# EasyEDA Pro project Arctos.eprj, schematic Schematic1
Board Name: Board1; Create Date: 2025-07-01; Page Name: P1; Project Name: Arctos; Schematic Name: Schematic1; Update Date: 2025-10-24; Company: arctosrobotics.com; Page Size: A3; Version: V1.3
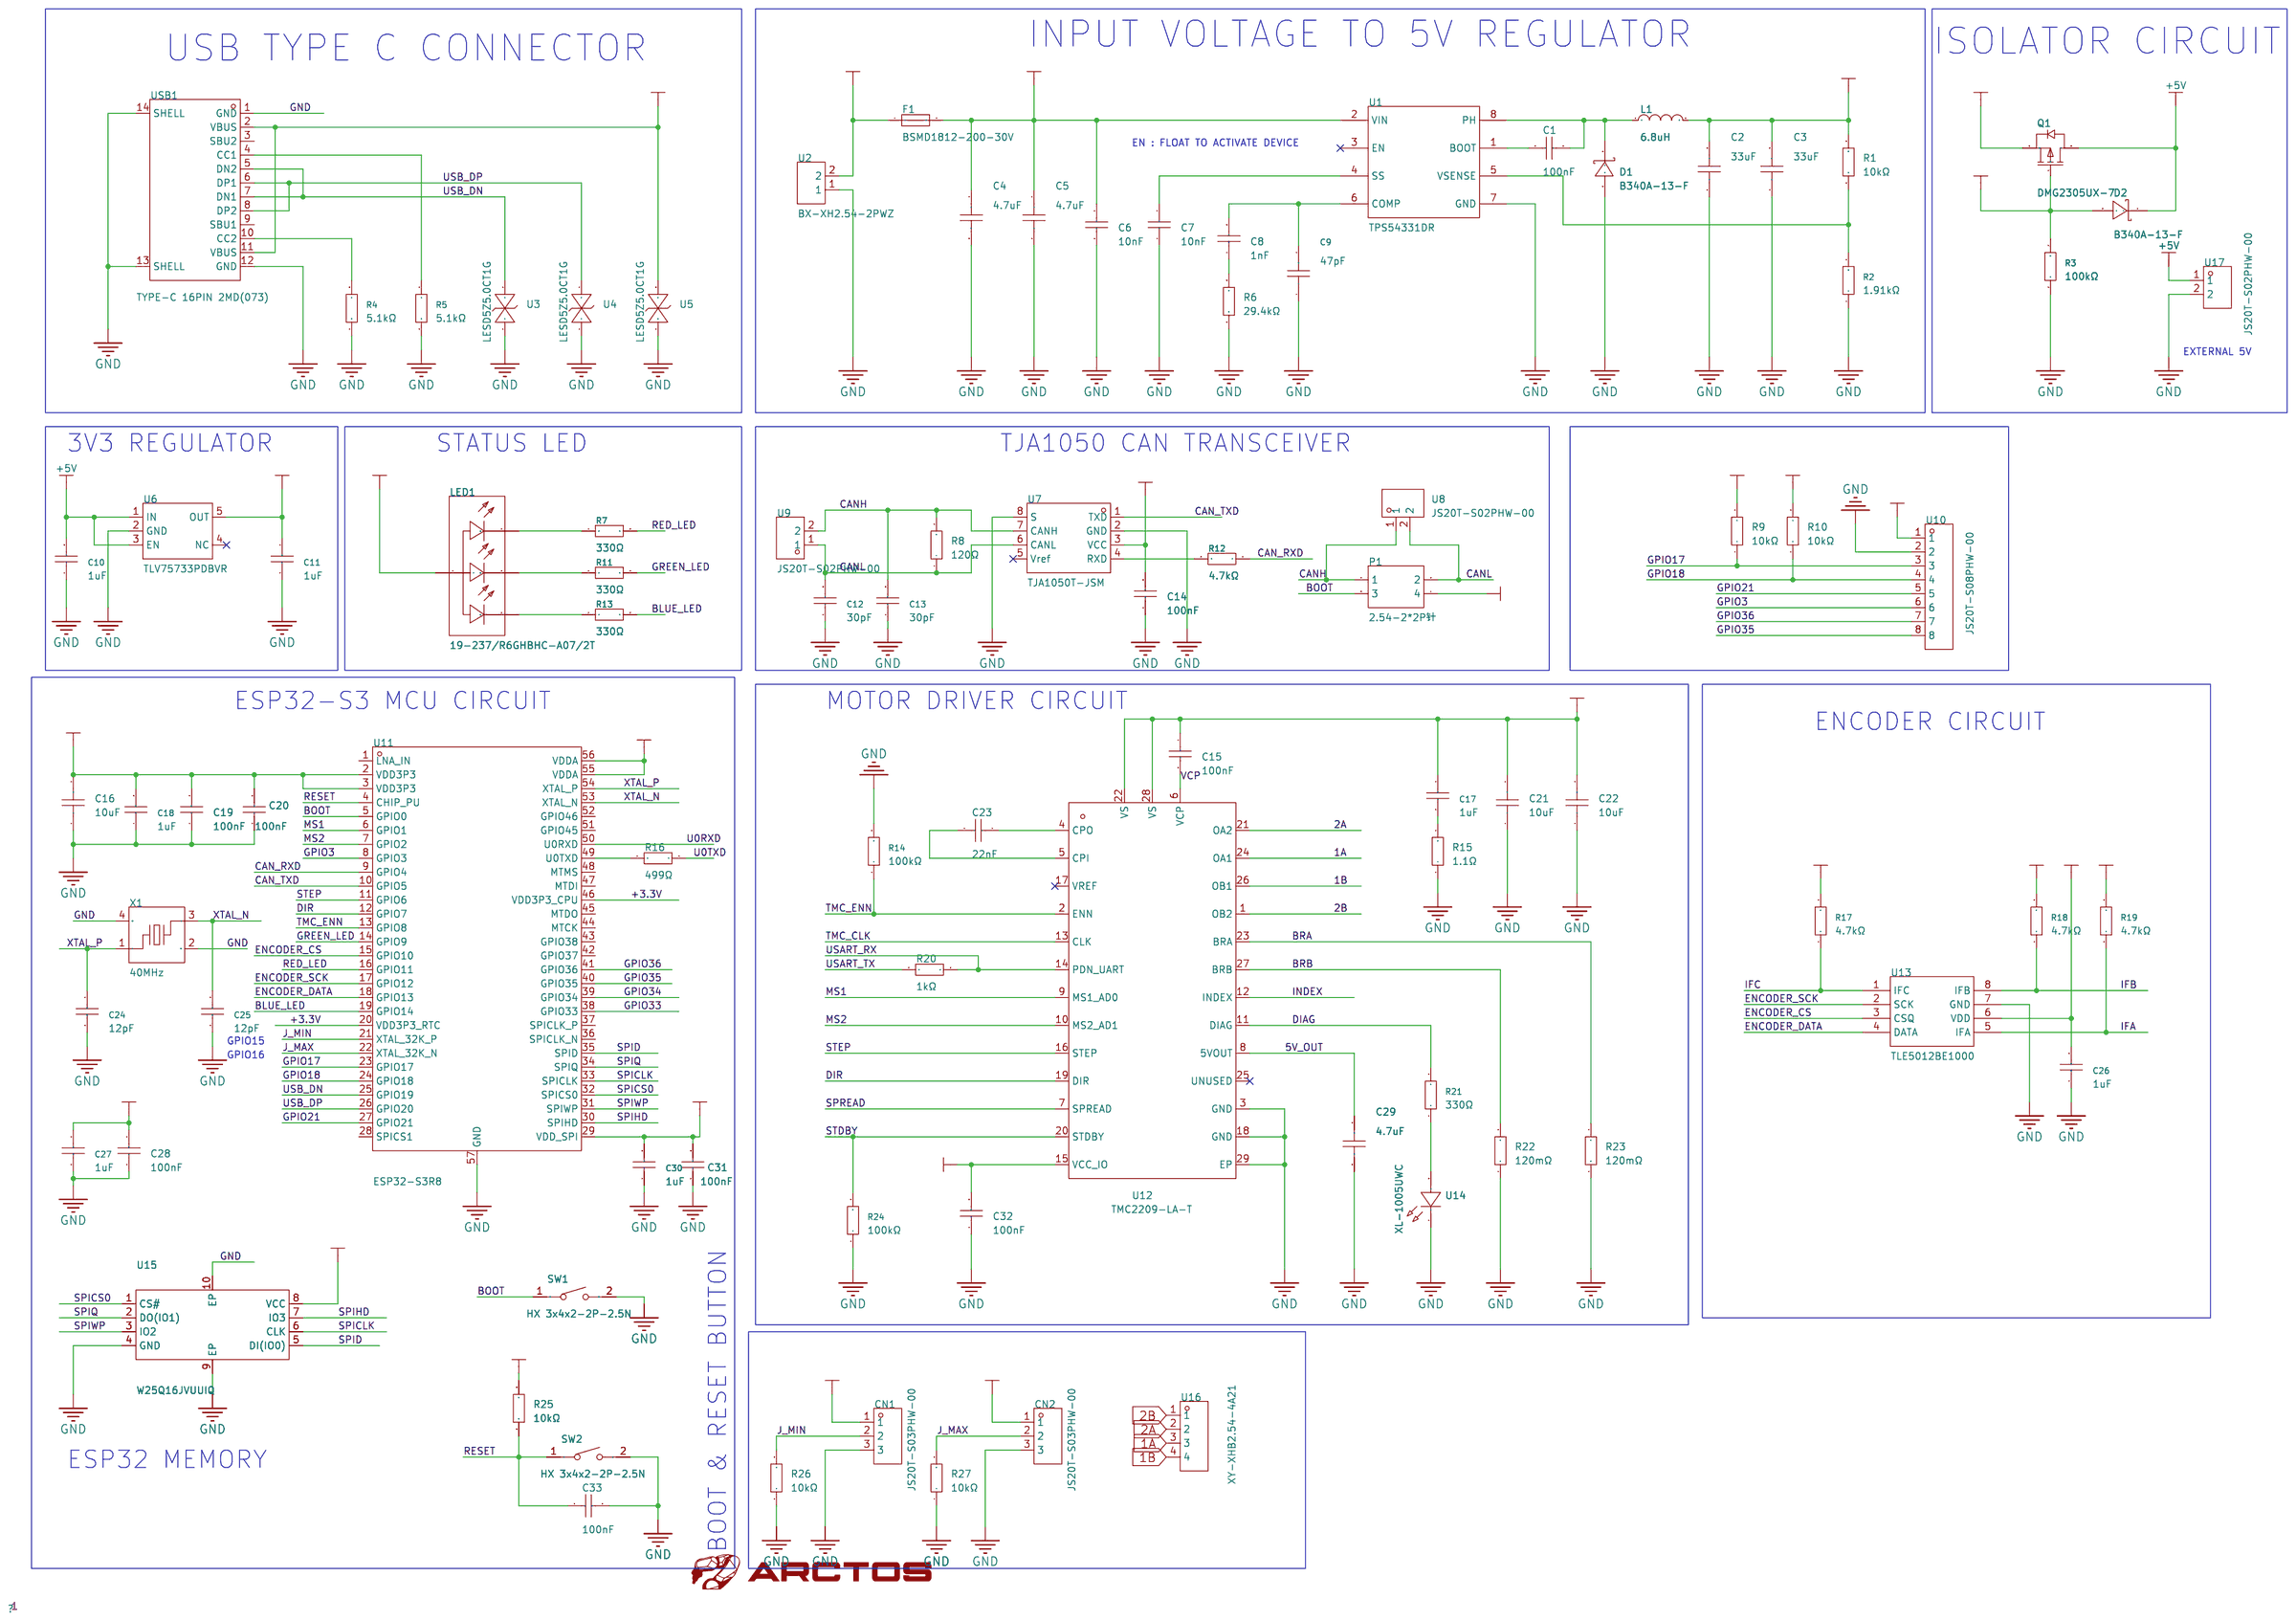
[diagram p0: schematic sheet]

## Parts
C1  100nF  [C0402]
C2  33uF  [C0805]
C3  33uF  [C0805]
C4  4.7uF  [C0603]
C5  4.7uF  [C0603]
C6  10nF  [C0402]
C7  10nF  [C0402]
C8  1nF  [C0402]
C9  47pF  [C0402]
C10  1uF  [C0402]
C11  1uF  [C0402]
C12  30pF  [C0402]
C13  30pF  [C0402]
C14  100nF  [C0402]
C15  100nF  [C0402]
C16  10uF  [C0402]
C17  1uF  [C0805]
C18  1uF  [C0402]
C19  100nF  [C0402]
C20  100nF  [C0402]
C21  10uF  [C0805]
C22  10uF  [C0805]
C23  22nF  [C0402]
C24  12pF  [C0402]
C25  12pF  [C0402]
C26  1uF  [C0402]
C27  1uF  [C0402]
C28  100nF  [C0402]
C29  4.7uF  [C0603]
C30  1uF  [C0402]
C31  100nF  [C0402]
C32  100nF  [C0402]
C33  100nF  [C0402]
CN1  JS20T-S03PHW-00  [CONN-TH_3P-P2.00_HC-PH-3AW-G]
CN2  JS20T-S03PHW-00  [CONN-TH_3P-P2.00_HC-PH-3AW-G]
D1  B340A-13-F  [SMA_L4.4-W2.6-LS5.0-RD]
D2  B340A-13-F  [SMA_L4.4-W2.6-LS5.0-RD]
F1  BSMD1812-200-30V  [F1812]
L1  6.8uH  [IND-SMD_L3.0-W3.0_FTC303020D]
LED1  19-237/R6GHBHC-A07/2T  [LED-ARRAY-SMD_4P-L1.6-W1.6-BL-CW]
P1  2.54-2*2P针  [HDR-TH_4P-P2.54-V-M-R2-C2-S2.54-1]
Q1  DMG2305UX-7  [SOT-23-3_L2.9-W1.3-P1.90-LS2.4-BR]
R1  10kΩ  [R0402]
R2  1.91kΩ  [R0402]
R3  100kΩ  [R0402]
R4  5.1kΩ  [R0402]
R5  5.1kΩ  [R0402]
R6  29.4kΩ  [R0402]
R7  330Ω  [R0402]
R8  120Ω  [R0402]
R9  10kΩ  [R0402]
R10  10kΩ  [R0402]
R11  330Ω  [R0402]
R12  4.7kΩ  [R0402]
R13  330Ω  [R0402]
R14  100kΩ  [R0402]
R15  1.1Ω  [R0603]
R16  499Ω  [R0402]
R17  4.7kΩ  [R0402]
R18  4.7kΩ  [R0402]
R19  4.7kΩ  [R0402]
R20  1kΩ  [R0402]
R21  330Ω  [R0402]
R22  120mΩ  [R1206]
R23  120mΩ  [R1206]
R24  100kΩ  [R0402]
R25  10kΩ  [R0402]
R26  10kΩ  [R0402]
R27  10kΩ  [R0402]
SW1  HX 3x4x2-2P-2.5N  [SW-SMD_L4.0-W2.9-LS5.0]
SW2  HX 3x4x2-2P-2.5N  [SW-SMD_L4.0-W2.9-LS5.0]
U1  TPS54331DR  [SOIC-8_L5.0-W4.0-P1.27-LS6.0-BL]
U2  BX-XH2.54-2PWZ  [CONN-TH_2P-P2.50_BX-XH2.54-2PWZ]
U3  LESD5Z5.0CT1G  [SOD-523_L1.2-W0.8-LS1.6-BI]
U4  LESD5Z5.0CT1G  [SOD-523_L1.2-W0.8-LS1.6-BI]
U5  LESD5Z5.0CT1G  [SOD-523_L1.2-W0.8-LS1.6-BI]
U6  TLV75733PDBVR  [SOT-23-5_L2.9-W1.6-P0.95-LS2.8-BL]
U7  TJA1050T-JSM  [SOIC-8_L4.9-W3.9-P1.27-LS6.0-BL]
U8  JS20T-S02PHW-00  [CONN-TH_JS20T-S02PHW-00]
U9  JS20T-S02PHW-00  [CONN-TH_JS20T-S02PHW-00]
U10  JS20T-S08PHW-00  [CONN-TH_8P-P2.00_JS20T-S08PHW]
U11  ESP32-S3R8  [QFN-56_L7.0-W7.0-P0.40-TL-EP4.0]
U12  TMC2209-LA-T  [QFN-28_L5.0-W5.0-P0.50-BL-EP]
U13  TLE5012BE1000  [PG-DSO-8_L5.0-W4.0-P1.27-LS6.0-BL]
U14  XL-1005UWC  [LED0402-RD_YELLOW]
U15  W25Q16JVUUIQ  [USON-8_L4.0-W3.0-P0.80-BL_AT25SL321]
U16  XY-XHB2.54-4A21  [HDR-TH_4P-P2.50-H-F-W7.3-N]
U17  JS20T-S02PHW-00  [CONN-TH_JS20T-S02PHW-00]
USB1  TYPE-C 16PIN 2MD(073)  [USB-C-SMD_TYPE-C-6PIN-2MD-073]
X1  40MHz  [CRYSTAL-SMD_4P-L1.6-W1.2-BL]

## Library data of the parts
C1 C14 C15 C19 C20 C28 C31-C33 = CC0402KRX7R9BB104: LCSC Part Name: 100nF ±10% 50V; Supplier Part: C131394; Manufacturer: YAGEO(国巨); Supplier Footprint: 0402; Datasheet: https://atta.szlcsc.com/upload/public/pdf/source/20181008/C309510_22F155564471FAF6A489F7D68F34234E.pdf; Supplier: LCSC; Tolerance: ±10%
C2 C3 = C2012X5R1A336MTJ00E: LCSC Part Name: 33uF ±20% 10V; Supplier Part: C342635; Manufacturer: TDK; Supplier Footprint: 0805; Datasheet: https://item.szlcsc.com/datasheet/C2012X5R1A336MTJ00E/319485.html; Supplier: LCSC; Tolerance: ±20%; Voltage Rating: 10V; Temperature Coefficient: X5R
C4 C5 C29 = CL10A475KL8NRNC: LCSC Part Name: 4.7uF ±10% 35V; Supplier Part: C307467; Manufacturer: SAMSUNG(三星); Supplier Footprint: 0603; JLCPCB Part Class: Extended Part; Datasheet: https://item.szlcsc.com/datasheet/CL10A475KL8NRNC/291141.html; Supplier: LCSC; Tolerance: ±10%; Voltage Rating: 35V; Temperature Coefficient: X5R
C6 C7 = CL05B103KB5NNNC: LCSC Part Name: 10nF ±10% 50V; Supplier Part: C15195; Manufacturer: SAMSUNG(三星); Supplier Footprint: 0402; JLCPCB Part Class: Basic Part; Datasheet: https://item.szlcsc.com/datasheet/CL05B103KB5NNNC/15869.html; Supplier: LCSC; Tolerance: ±10%; Voltage Rating: 50V; Temperature Coefficient: X7R
C8 = CL05B102KB5NNNC: LCSC Part Name: 1nF ±10% 50V; Supplier Part: C14442; Manufacturer: SAMSUNG(三星); Supplier Footprint: 0402; Datasheet: https://item.szlcsc.com/datasheet/CL05B102KB5NNNC/15104.html; Supplier: LCSC; Tolerance: ±10%; Voltage Rating: 50V; Temperature Coefficient: X7R
C9 = CL05C470JB51PNC: LCSC Part Name: 47pF ±5% 50V; Supplier Part: C472454; Manufacturer: SAMSUNG(三星); Supplier Footprint: 0402; Datasheet: https://item.szlcsc.com/datasheet/CL05C470JB51PNC/478910.html; Supplier: LCSC; Tolerance: ±5%; Voltage Rating: 50V; Temperature Coefficient: C0G
C10 C11 C18 C26 C27 C30 = CL05A105KO5NNNC: LCSC Part Name: 1uF ±10% 16V; Supplier Part: C29266; Manufacturer: SAMSUNG(三星); Supplier Footprint: 0402; JLCPCB Part Class: Extended Part; Datasheet: https://item.szlcsc.com/datasheet/CL05A105KO5NNNC/30018.html; Supplier: LCSC; Tolerance: ±10%; Voltage Rating: 16V; Temperature Coefficient: X5R
C12 C13 = CC0402JRNPO9BN300: LCSC Part Name: 30pF ±5% 50V; Supplier Part: C107004; Manufacturer: YAGEO(国巨); Supplier Footprint: 0402; Datasheet: https://item.szlcsc.com/datasheet/CC0402JRNPO9BN300/108220.html; Supplier: LCSC; Tolerance: ±5%; Voltage Rating: 50V; Temperature Coefficient: NP0
C16 = CL05A106MP5NUNC_C315248: LCSC Part Name: 10uF ±20% 10V; Supplier Part: C315248; Manufacturer: SAMSUNG(三星); Manufacturer Part: CL05A106MP5NUNC; Supplier Footprint: 0402; Datasheet: https://item.szlcsc.com/datasheet/CL05A106MP5NUNC/297154.html; Supplier: LCSC; Tolerance: ±20%; Voltage Rating: 10V; Temperature Coefficient: X5R
C17 = CL21B105KBFNNNE: LCSC Part Name: 1uF ±10% 50V; Supplier Part: C28323; Manufacturer: SAMSUNG(三星); Supplier Footprint: 0805; JLCPCB Part Class: Basic Part; Datasheet: https://item.szlcsc.com/datasheet/CL21B105KBFNNNE/29074.html; Supplier: LCSC; Tolerance: ±10%; Voltage Rating: 50V; Temperature Coefficient: X7R
C21 C22 = CL21A106KBYQNNE: LCSC Part Name: 10uF ±10% 50V; Supplier Part: C2932476; Manufacturer: SAMSUNG(三星); Supplier Footprint: 0805; Datasheet: https://item.szlcsc.com/datasheet/CL21A106KBYQNNE/3277789.html; Supplier: LCSC; Tolerance: ±10%; Voltage Rating: 50V; Temperature Coefficient: X5R
C23 = CL05B223KB5NNNC: LCSC Part Name: 22nF ±10% 50V; Supplier Part: C337699; Manufacturer: SAMSUNG(三星); Supplier Footprint: 0402; Datasheet: https://item.szlcsc.com/datasheet/CL05B223KB5NNNC/315756.html; Supplier: LCSC; Tolerance: ±10%; Voltage Rating: 50V; Temperature Coefficient: X7R
C24 C25 = CL05C120JB5NNNC: LCSC Part Name: 12pF ±5% 50V; Supplier Part: C26406; Manufacturer: SAMSUNG(三星); Supplier Footprint: 0402; Datasheet: https://item.szlcsc.com/datasheet/CL05C120JB5NNNC/27150.html; Supplier: LCSC; Tolerance: ±5%; Voltage Rating: 50V; Temperature Coefficient: C0G
CN1 CN2 = JS20T-S03PHW-00: Supplier Part: C7499303; Manufacturer: JS(钜硕电子); Supplier Footprint: 插件,P=2.0mm; JLCPCB Part Class: Extended Part; Datasheet: https://atta.szlcsc.com/upload/public/pdf/source/20230809/E6337CD797A912ED7011A9EA7A78FFDE.pdf; Supplier: LCSC; Pins Structure: 1x3P; Pitch: 2mm; Mounting Style: Bend insert; Reference Series: PH; Number of Pins: 3P; Number of Rows: 1; Number of PINs Per Row: 3; Contact Material: Brass
D1 D2 = B340A-13-F: LCSC Part Name: 电压:40V 电流:3A; Supplier Part: C85098; Manufacturer: DIODES(美台); Supplier Footprint: SMA(DO-214AC); Datasheet: https://item.szlcsc.com/datasheet/B340A-13-F/86270.html; Supplier: LCSC; Voltage - Forward(Vf@If): 500mV@3A; Voltage - DC Reverse(Vr): 40V; Current - Rectified: 3A; Reverse Leakage Current (Ir): 500uA@40V; Operating Junction Temperature Range: -55℃~+150℃; Non-Repetitive Peak Forward Surge Current: 80A
F1 = BSMD1812-200-30V: LCSC Part Name: 30V 2A 1812自恢复; Supplier Part: C960026; Manufacturer: BHFUSE(佰宏); Supplier Footprint: 1812; JLCPCB Part Class: Extended Part; Datasheet: https://item.szlcsc.com/datasheet/BSMD1812-200-30V/1039126.html; Supplier: LCSC; Voltage - Max: 30V; Current - Max: 40A; Hold Current: 2A; Trip Current: 4A; Power Dissipation: 1W; Resistance - Initial (Ri) (Min): 20mΩ; Resistance - Post Trip (R1) (Max): 100mΩ; Operating Temperature: -40℃~+85℃; Length: 4.73mm; Width: 3.41mm; Height: 1.5mm
L1 = FTC303020D6R8MBCA: LCSC Part Name: 6.8uH ±20% 4.5A; Supplier Part: C7423322; Manufacturer: cjiang(长江微电); Supplier Footprint: SMD,3x3mm; Datasheet: https://atta.szlcsc.com/upload/public/pdf/source/20240918/5AD8A1A0D9C2859F32750FF2CC514AFA.pdf; Supplier: LCSC; Tolerance: ±20%; Current Rating: 3.2A; Current - Saturation(Isat): 4.5A; DC Resistance(DCR): 107mΩ
LED1 = 19-237/R6GHBHC-A07/2T: LCSC Part Name: RGB三色; Supplier Part: C264511; Manufacturer: EVERLIGHT(亿光); Supplier Footprint: 0606; JLCPCB Part Class: Extended Part; Datasheet: https://atta.szlcsc.com/upload/public/pdf/source/20180817/C264511_F0AB6A4CBE46616C77A38D5D38B86709.pdf; Supplier: LCSC
P1 = 2.54-2*2P针: LCSC Part Name: 间距:2.54mm 直插; Supplier Part: C66690; Manufacturer: BOOMELE(博穆精密); Supplier Footprint: 插件,P=2.54mm; JLCPCB Part Class: Extended Part; Datasheet: https://atta.szlcsc.com/upload/public/pdf/source/20221201/C605E3BE9C0F7226363017EFD1BDE852.pdf; Supplier: LCSC; Pitch: 2.54mm; Row Spacing: 2.54mm; Mounting Type: Straight; Number of Rows: Double Row; Number of Pins: 4P; Color: Black
Q1 = DMG2305UX-7: LCSC Part Name: 1个P沟道 耐压:20V 电流:5A; Supplier Part: C150470; Manufacturer: DIODES(美台); Supplier Footprint: SOT-23; Datasheet: https://item.szlcsc.com/datasheet/DMG2305UX-7/161808.html; Supplier: LCSC; Number: 1 P-Channel; Drain to Source Voltage: 20V; Current - Continuous Drain(Id): 5A; RDS(on): 52mΩ@4.5V；100mΩ@2.5V; Pd - Power Dissipation: 1.4W; Gate Threshold Voltage (Vgs(th)): 900mV@250uA; Gate Charge(Qg): 10.2nC@4.5V; Input Capacitance(Ciss): 808pF; Reverse Transfer Capacitance (Crss@Vds): 77pF; Operating Temperature: -55℃~+150℃; Type: P-Channel; Output Capacitance(Coss): 85pF
R1 R9 R10 R25-R27 = 0402WGF1002TCE: LCSC Part Name: 10kΩ ±1% 62.5mW 厚膜电阻; Supplier Part: C25744; Manufacturer: UNI-ROYAL(厚声); Supplier Footprint: 0402; Datasheet: https://item.szlcsc.com/datasheet/0402WGF1002TCE/26487.html; Supplier: LCSC; Type: Thick Film Resistor; Tolerance: ±1%; Power(Watts): 62.5mW; Voltage-Supply(Max): 50V; Temperature Coefficient: ±100ppm/℃; Operating Temperature: -55℃~+155℃
R2 = 0402WGF1911TCE: LCSC Part Name: 1.91kΩ ±1% 62.5mW 厚膜电阻; Supplier Part: C36951; Manufacturer: UNI-ROYAL(厚声); Supplier Footprint: 0402; Datasheet: https://item.szlcsc.com/datasheet/0402WGF1911TCE/37929.html; Supplier: LCSC; Type: Thick Film Resistor; Tolerance: ±1%; Power(Watts): 62.5mW; Voltage-Supply(Max): 50V; Temperature Coefficient: ±100ppm/℃; Operating Temperature: -55℃~+155℃
R3 R14 R24 = 0402WGF1003TCE: LCSC Part Name: 100kΩ ±1% 62.5mW 厚膜电阻; Supplier Part: C25741; Manufacturer: UNI-ROYAL(厚声); Supplier Footprint: 0402; Datasheet: https://item.szlcsc.com/datasheet/0402WGF1003TCE/26484.html; Supplier: LCSC; Type: Thick Film Resistor; Tolerance: ±1%; Power(Watts): 62.5mW; Voltage-Supply(Max): 50V; Temperature Coefficient: ±100ppm/℃; Operating Temperature: -55℃~+155℃
R4 R5 = 0402WGF5101TCE: LCSC Part Name: 5.1kΩ ±1% 62.5mW 厚膜电阻; Supplier Part: C25905; Manufacturer: UNI-ROYAL(厚声); Supplier Footprint: 0402; Datasheet: https://item.szlcsc.com/datasheet/0402WGF5101TCE/26648.html; Supplier: LCSC; Type: Thick Film Resistor; Tolerance: ±1%; Power(Watts): 62.5mW; Voltage-Supply(Max): 50V; Temperature Coefficient: ±100ppm/℃; Operating Temperature: -55℃~+155℃
R6 = RC0402FR-0729K4L: LCSC Part Name: 厚膜电阻 29.4kΩ ±1% 62.5mW; Supplier Part: C327356; Manufacturer: YAGEO(国巨); Supplier Footprint: 0402; JLCPCB Part Class: Extended Part; Datasheet: https://item.szlcsc.com/datasheet/RC0402FR-0729K4L/307450.html; Supplier: LCSC; Type: Thick Film Resistor; Tolerance: ±1%; Power(Watts): 62.5mW; Voltage-Supply(Max): 50V; Temperature Coefficient: ±100ppm/℃; Operating Temperature: -55℃~+155℃
R7 R11 R13 R21 = 0402WGF3300TCE: LCSC Part Name: 330Ω ±1% 62.5mW 厚膜电阻; Supplier Part: C25104; Manufacturer: UNI-ROYAL(厚声); Supplier Footprint: 0402; Datasheet: https://item.szlcsc.com/datasheet/0402WGF3300TCE/25847.html; Supplier: LCSC; Type: Thick Film Resistors; Tolerance: ±1%; Power(Watts): 1/16W; Voltage-Supply(Max): 50V; Temperature Coefficient: ±100ppm/℃; Operating Temperature: -55℃~+155℃
R8 = 0402WGF1200TCE: LCSC Part Name: 120Ω ±1% 62.5mW 厚膜电阻; Supplier Part: C25079; Manufacturer: UNI-ROYAL(厚声); Supplier Footprint: 0402; Datasheet: https://item.szlcsc.com/datasheet/0402WGF1200TCE/25822.html; Supplier: LCSC; Type: Thick Film Resistor; Tolerance: ±1%; Power(Watts): 62.5mW; Voltage-Supply(Max): 50V; Temperature Coefficient: ±100ppm/℃; Operating Temperature: -55℃~+155℃
R12 R17-R19 = 0402WGF4701TCE: LCSC Part Name: 4.7kΩ ±1% 62.5mW 厚膜电阻; Supplier Part: C25900; Manufacturer: UNI-ROYAL(厚声); Supplier Footprint: 0402; Datasheet: https://item.szlcsc.com/datasheet/0402WGF4701TCE/26643.html; Supplier: LCSC; Type: Thick Film Resistor; Tolerance: ±1%; Power(Watts): 62.5mW; Voltage-Supply(Max): 50V; Temperature Coefficient: ±100ppm/℃; Operating Temperature: -55℃~+155℃
R15 = RC0603FR-071R1L: LCSC Part Name: 厚膜电阻 1.1Ω ±1% 100mW; Supplier Part: C309559; Manufacturer: YAGEO(国巨); Supplier Footprint: 0603; Datasheet: https://atta.szlcsc.com/upload/public/pdf/source/20250610/89E4D743C004A82A45145C7A2CC3A578.pdf; Supplier: LCSC; Type: Thick Film Resistor; Tolerance: ±1%; Power(Watts): 100mW; Voltage-Supply(Max): 75V; Temperature Coefficient: ±200ppm/℃; Operating Temperature: -55℃~+155℃
R16 = 0402WGF4990TCE: LCSC Part Name: 499Ω ±1% 62.5mW 厚膜电阻; Supplier Part: C4125; Manufacturer: UNI-ROYAL(厚声); Supplier Footprint: 0402; Datasheet: https://atta.szlcsc.com/upload/public/pdf/source/20200306/C422600_1E6D84923E4A46A82E41ADD87F860B5C.pdf; Supplier: LCSC; Type: Thick Film Resistors; Tolerance: ±1%; Temperature Coefficient: ±100ppm/℃; Operating Temperature Range: -55℃~+155℃
R20 = 0402WGF1001TCE: LCSC Part Name: 1kΩ ±1% 62.5mW 厚膜电阻; Supplier Part: C11702; Manufacturer: UNI-ROYAL(厚声); Supplier Footprint: 0402; Datasheet: https://item.szlcsc.com/datasheet/0402WGF1001TCE/12256.html; Supplier: LCSC; Type: Thick Film Resistor; Tolerance: ±1%; Power(Watts): 62.5mW; Voltage-Supply(Max): 50V; Temperature Coefficient: ±100ppm/℃; Operating Temperature: -55℃~+155℃
R22 R23 = STE1206M1W0R120F: LCSC Part Name: 120mΩ ±1% 1W; Supplier Part: C201309; Manufacturer: WALTER(华德); Supplier Footprint: 1206; Datasheet: https://item.szlcsc.com/datasheet/STE1206M1W0R120F/202615.html; Supplier: LCSC; Tolerance: ±1%; Power(Watts): 1W; Temperature Coefficient: ±50ppm/℃
SW1 SW2 = HX 3x4x2-2P-2.5N: LCSC Part Name: 4*3*2mm 立贴 轻触开关; Supplier Part: C36498961; Manufacturer: hanxia(韩下); Supplier Footprint: SMD,3x4mm; JLCPCB Part Class: Extended Part; Datasheet: https://atta.szlcsc.com/upload/public/pdf/source/20241226/E966882069CEFB4DD959391A5A1F9528.pdf; Supplier: LCSC; Actuator Style: Star-Shaped Button; Operating Force: 2.5N; Mounting Style: Standing paste; Switch Length: 4mm; Switch Width: 3mm; Switch Height: 2mm; Contact Current: 50mA; Voltage Rating: 12V; Actuator/Cap Color: Black; With Lamp: None; Pin Style: SMDSplicing; Mechanical Life: 100,000 Times; Operating Temperature: -25℃~+70℃
U1 = TPS54331DR: LCSC Part Name: 3A, 28V 输入非同步降压转换器; Supplier Part: C9865; Manufacturer: TI(德州仪器); Supplier Footprint: SOIC-8; JLCPCB Part Class: Extended Part; Datasheet: https://www.ti.com/cn/lit/gpn/tps54331; Supplier: LCSC; Function: Step-down type; Output Type: Adjustable; Input Voltage: 3.5V~28V; Output Current: 3A; Switching Frequency: 570kHz; Operating Temperature: -40℃~+150℃@(TJ); Synchronous Rectification: No; Number of Outputs: 1; Topology: Step-down; Quiescent Current (Iq): 1mA; Switch tube (built-in/external): Built-in
U2 = BX-XH2.54-2PWZ: LCSC Part Name: 1x2P 间距:2.5mm 弯插 系列:XH; Supplier Part: C18077842; Manufacturer: Bossie(博锡); Supplier Footprint: 弯插,P=2.54mm; JLCPCB Part Class: Extended Part; Datasheet: https://atta.szlcsc.com/upload/public/pdf/source/20231017/64887DF7727E4B3D8F2333E1BBE193AA.pdf; Supplier: LCSC; Pins Structure: 1x2P; Pitch: 2.5mm; Mounting Type: Bend-in; Reference Series: XH; Number of Pins: 2P; Number of Rows: 1; Number of PINs Per Row: 2; Current Rating: 3A; Contact Material: Brass; Contact Plating: Tin; Operating Temperature: -25℃~+85℃; Voltage Rating: 250V; Plastic Material: PA66; Flame Retardant Rating: UL94V-0; Color: White; Z-Height of the Board: 5.9mm; X-Length of Bottom Edge on Board (Spacing Line): 7.5mm; Y-Width of Bottom Edge on Board: 7.32mm
U3-U5 = LESD5Z5.0CT1G_C5451650: LCSC Part Name: 5V 15PF 双向; Supplier Part: C5451650; Manufacturer: HXY MOSFET(华轩阳电子); Supplier Footprint: SOD-523; JLCPCB Part Class: Extended Part; Datasheet: https://atta.szlcsc.com/upload/public/pdf/source/20230427/2F645B9D698C2F305680EBFB223778D0.pdf; Supplier: LCSC; polarity: Bidirectional; Reverse Stand-Off Voltage (Vrwm): 5V; Maximum Clamping Voltage: 11.6V; Peak Pulse Current (Ipp): 9A; Breakdown Voltage: 7.8V; Number of Lines: Single channel; Type: ESD
U6 = TLV75733PDBVR: LCSC Part Name: 具有使能功能的 1A、低 IQ、高精度、低压降稳压器; Supplier Part: C485517; Manufacturer: TI(德州仪器); Supplier Footprint: SOT-23-5; JLCPCB Part Class: Extended Part; Datasheet: https://www.ti.com/cn/lit/gpn/tlv757p; Supplier: LCSC; Output Type: Fixed; Maximum Input Voltage: 5.5V; Output Voltage: 3.3V; Output Current: 1A; Power Supply Rejection Ratio (PSRR): 52dB; Dropout Voltage: 475mV@(1A); Feature: ESD Protection；Surge Protection；Low ESR；Thermal Protection(TSD)；Under-voltage Lockout；Overcurrent Protection(OCP)；With ability; Operating Temperature: -40℃~+125℃@(Tj); Output Polarity: Positive electrode; Number of Outputs: 1
U7 = TJA1050T-JSM: LCSC Part Name: TJA1050T; Supplier Part: C21714366; Manufacturer: JSMSEMI(杰盛微); Supplier Footprint: SOP-8; Datasheet: https://item.szlcsc.com/datasheet/TJA1050T-JSM/23141576.html; Supplier: LCSC; Data Rate: 1Mbps; Voltage - Supply: 4.5V~5.5V; Current - Supply: 50mA; Operating Temperature: -40℃~+150℃
U8 U9 U17 = JS20T-S02PHW-00: Supplier Part: C7499302; Manufacturer: JS(钜硕电子); Supplier Footprint: 插件,P=2.0mm; JLCPCB Part Class: Extended Part; Datasheet: https://atta.szlcsc.com/upload/public/pdf/source/20230809/E6337CD797A912ED7011A9EA7A78FFDE.pdf; Supplier: LCSC; Pins Structure: 1x2P; Pitch: 2mm; Mounting Style: Bend insert; Reference Series: PH; Number of Pins: 2P; Number of Rows: 1; Number of PINs Per Row: 2; Contact Material: Brass
U10 = JS20T-S08PHW-00: Supplier Part: C7499308; Manufacturer: JS(钜硕电子); Supplier Footprint: 插件,P=2.0mm; JLCPCB Part Class: Extended Part; Datasheet: https://atta.szlcsc.com/upload/public/pdf/source/20230809/E6337CD797A912ED7011A9EA7A78FFDE.pdf; Supplier: LCSC; Pins Structure: 1x8P; Pitch: 2mm; Mounting Style: Bend-in; Reference Series: PH; Number of Pins: 8P; Number of Rows: 1; Number of PINs Per Row: 8; Contact Material: Brass
U11 = ESP32-S3R8: Supplier Part: C2913194; Manufacturer: ESPRESSIF(乐鑫); Supplier Footprint: QFN-56(7x7); JLCPCB Part Class: Extended Part; Datasheet: https://item.szlcsc.com/datasheet/ESP32-S3R8/3198292.html; Supplier: LCSC; Frequency Range: 2.412GHz~2.484GHz; Interface: I2C；I2S；UART；USB；SPI; Voltage - Supply: 3V~3.6V; Applications: Bluetooth；IoT；WiFi; Output Power: 18.5dBm; Data Rate: 150Mbps; Current Of Transmitting: 283mA; Sensitivity: -74.2dBm; Receive Current: 88mA; Typical Application Frequency: 2.4GHz; Operating Temperature: -40℃~+65℃
U12 = TMC2209-LA-T: Technology:Yes Voltage - Supply:4.75V~29V Voltage - Supply:4.75V~29V Output Current:- Output Current:- Interface:STEP/DIR；UART Step Resolution:8；64；256；16；32 RDS(on):340mΩ Operating Temperature:-40℃~+125℃ Operating Temperature:-40℃~+125℃; LCSC Part Name: 2A 5.25V电机驱动芯片; Supplier Part: C2150710; Manufacturer: TRINAMIC; Supplier Footprint: QFN-28-EP(5x5); JLCPCB Part Class: Extended Part; Datasheet: https://atta.szlcsc.com/upload/public/pdf/source/20210607/D0A4AAF613355E2D9215E68319997CCC.pdf; Supplier: LCSC; Technology: Yes; Voltage - Supply: 4.75V~29V; Interface: STEP/DIR；UART; Step Resolution: 8；64；256；16；32; RDS(on): 340mΩ; Operating Temperature: -40℃~+125℃
U13 = TLE5012BE1000: Supplier Part: C123083; Manufacturer: Infineon(英飞凌); Supplier Footprint: SO-8; JLCPCB Part Class: Extended Part; Datasheet: https://atta.szlcsc.com/upload/public/pdf/source/20170728/C123083_1501225763065848823.pdf; Supplier: LCSC
U14 = XL-1005UWC_C20613596: Supplier Part: C20613596; Manufacturer: XINGLIGHT(成兴光); Supplier Footprint: 0402; Datasheet: https://atta.szlcsc.com/upload/public/pdf/source/20221102/EACC1BAE175C81995A6088DD8BE6A010.pdf; Supplier: LCSC
U15 = W25Q16JVUUIQ: LCSC Part Name: 支持双/四路SPI接口的3V、16Mbit 串行闪存; Supplier Part: C571259; Manufacturer: Winbond(华邦); Supplier Footprint: USON-8(3x4); Datasheet: https://item.szlcsc.com/datasheet/W25Q16JVUUIQ/597703.html; Supplier: LCSC; Interface: SPI; Memory Size: 16Mbit; Clock Frequency: 133MHz; Voltage - Supply: 2.7V~3.6V; Program / Erase Cycles: 100,000 Cycles; Page Programming Time (Tpp): 400us; Block Erase Time(tBE): 150ms@(64KB); Data Retention - TDR (Year): 20 Years; Operating Temperature: -40℃~+85℃
U16 = XY-XHB2.54-4A21: LCSC Part Name: 1x4P 间距:2.54mm 弯插; Supplier Part: C19271397; Manufacturer: XYECONN(辛译); Supplier Footprint: 弯插,P=2.54mm; JLCPCB Part Class: Extended Part; Datasheet: https://atta.szlcsc.com/upload/public/pdf/source/20231124/E581531705911B495C6E735B7C4EA3F8.pdf; Supplier: LCSC; Pins Structure: 1x4P; Pitch: 2.54mm; Mounting Style: Right-Angle; Number of Pins: 4P; Number of Rows: 1; Number of PINs Per Row: 4; Row Spacing: 2.54mm; Current Rating (Max): 2A; Operating Temperature Range: -25℃~+85℃
USB1 = TYPE-C 16PIN 2MD(073): LCSC Part Name: Type-C 母 卧贴; Supplier Part: C2765186; Manufacturer: SHOU HAN(首韩); Supplier Footprint: SMD; JLCPCB Part Class: Extended Part; Datasheet: https://atta.szlcsc.com/upload/public/pdf/source/20250506/FFB74EDFDFA0AC372CE4A8E4F739CCEF.pdf; Supplier: LCSC; Connector Type: Type-C; Protocol Standard: USB 3.1; Gender: Female; Mounting Type: Surface Mount, Right Angle; Number of Contacts: 16P; Number of Ports: 1; Current Rating-Power: 3A; Voltage Rating: 5V; Connect-Disconnect Life: 5,000 Cycles; Detection color: Black; Operating Temperature: -25℃~+85℃
X1 = SX0B40.000F0810F30: LCSC Part Name: 40MHz ±10ppm 8pF; Supplier Part: C7301926; Manufacturer: SCTF(星通时频); Supplier Footprint: SMD1612-4P; Datasheet: https://item.szlcsc.com/datasheet/SX0B40.000F0810F30/8272179.html; Supplier: LCSC; Type: Crystal Oscillator; Normal temperature Frequency Tolerance: ±10ppm; Load Capacitance: 8pF; Frequency Stability: ±30ppm; Equivalent Series Resistance(ESR): 80Ω; Operating Temperature: -40℃~+85℃

## Nets
5V_OUT: C29.1 U12.8(5VOUT)
+3.3V: C11.2 C14.2 C16.2 C18.2 C19.2 C20.2 C26.2 C27.2 C28.2 C32.2 CN1.1 CN2.1 LED1.4(+) P1.4 R9.2 R10.2 R17.2 R18.2 R19.2 R25.2 U6.5(OUT) U7.3(VCC) U10.1 U11.2(VDD3P3) U11.3(VDD3P3) U11.20(VDD3P3_RTC) U11.46(VDD3P3_CPU) U11.55(VDDA) U11.56(VDDA) U12.15(VCC_IO) U13.6(VDD)
+5V: C10.2 D2.1(K) Q1.3(D) U6.1(IN) U6.3(EN) U17.1
+24V: C15.1 C17.2 C21.2 C22.2 F1.1 U2.2 U12.22(VS) U12.28(VS)
GND: C2.1 C3.1 C4.2 C5.2 C6.1 C7.1 C9.1 C10.1 C11.1 C12.1 C13.1 C14.1 C16.1 C18.1 C19.1 C20.1 C21.1 C22.1 C24.1 C25.1 C26.1 C27.1 C28.1 C29.2 C30.1 C31.1 C32.1 C33.1 CN1.3 CN2.3 D1.2(A) R2.1 R3.1 R4.1 R5.1 R6.1 R14.2 R15.1 R22.1 R23.1 R24.1 R26.1 R27.1 SW1.2 SW2.2 U1.7(GND) U2.1 U3.1 U4.1 U5.1 U6.2(GND) U7.2(GND) U7.8(S) U10.2 U11.57(GND) U12.3(GND) U12.18(GND) U12.29(EP) U13.7(GND) U14.1(K) U15.4(GND) U15.9(EP) U15.10(EP) U17.2 USB1.1(GND) USB1.12(GND) USB1.13(SHELL) USB1.14(SHELL) X1.2(GND) X1.4(GND)
VBUS: D2.2(A) Q1.1(G) R3.2 U5.2 USB1.2(VBUS) USB1.11(VBUS)
VCC_5V: C2.2 C3.2 L1.2 Q1.2(S) R1.2
VDD_SPI: C30.2 C31.2 U11.29(VDD_SPI) U15.8(VCC)
VIN: C4.1 C5.1 C6.2 F1.2 U1.2(VIN)
1A: U12.24(OA1) U16.3
1B: U12.26(OB1) U16.4
2A: U12.21(OA2) U16.2
2B: U12.1(OB2) U16.1
BLUE_LED: R13.2 U11.19(GPIO14)
BOOT: P1.3 SW1.1 U11.5(GPIO0)
BRA: R23.2 U12.23(BRA)
BRB: R22.2 U12.27(BRB)
CAN_RXD: R12.1 U11.9(GPIO4)
CAN_TXD: U7.1(TXD) U11.10(GPIO5)
CANH: C13.2 P1.1 R8.2 U7.7(CANH) U8.1 U9.2
CANL: C12.2 P1.2 R8.1 U7.6(CANL) U8.2 U9.1
DIAG: R21.2 U12.11(DIAG)
DIR: U11.12(GPIO7) U12.19(DIR)
ENCODER_CS: U11.15(GPIO10) U13.3(CSQ)
ENCODER_DATA: U11.18(GPIO13) U13.4(DATA)
ENCODER_SCK: U11.17(GPIO12) U13.2(SCK)
GPIO3: U10.6 U11.8(GPIO3)
GPIO17: R9.1 U10.3 U11.23(GPIO17)
GPIO18: R10.1 U10.4 U11.24(GPIO18)
GPIO21: U10.5 U11.27(GPIO21)
GPIO33: U11.38(GPIO33)
GPIO34: U11.39(GPIO34)
GPIO35: U10.8 U11.40(GPIO35)
GPIO36: U10.7 U11.41(GPIO36)
GREEN_LED: R11.2 U11.14(GPIO9)
IFA: R19.1 U13.5(IFA)
IFB: R18.1 U13.8(IFB)
IFC: R17.1 U13.1(IFC)
INDEX: U12.12(INDEX)
J_MAX: CN2.2 R27.2 U11.22(XTAL_32K_N)
J_MIN: CN1.2 R26.2 U11.21(XTAL_32K_P)
MS1: U11.6(GPIO1) U12.9(MS1_AD0)
MS2: U11.7(GPIO2) U12.10(MS2_AD1)
RED_LED: R7.2 U11.16(GPIO11)
RESET: C33.2 R25.1 SW2.1 U11.4(CHIP_PU)
SPICLK: U11.33(SPICLK) U15.6(CLK)
SPICS0: U11.32(SPICS0) U15.1(CS#)
SPID: U11.35(SPID) U15.5(DI(IO0))
SPIHD: U11.30(SPIHD) U15.7(IO3)
SPIQ: U11.34(SPIQ) U15.2(DO(IO1))
SPIWP: U11.31(SPIWP) U15.3(IO2)
SPREAD: U12.7(SPREAD)
STDBY: R24.2 U12.20(STDBY)
STEP: U11.11(GPIO6) U12.16(STEP)
TMC_CLK: U12.13(CLK)
TMC_ENN: R14.1 U11.13(GPIO8) U12.2(ENN)
U0RXD: U11.50(U0RXD)
U0TXD: R16.2
USART_RX: R20.2 U12.14(PDN_UART)
USART_TX: R20.1
USB_DN: U3.2 U11.25(GPIO19) USB1.5(DN2) USB1.7(DN1)
USB_DP: U4.2 U11.26(GPIO20) USB1.6(DP1) USB1.8(DP2)
VCP: C15.2 U12.6(VCP)
XTAL_N: C25.2 U11.53(XTAL_N) X1.3
XTAL_P: C24.2 U11.54(XTAL_P) X1.1
$1N36786: R5.2 USB1.4(CC1)
$1N36791: R4.2 USB1.10(CC2)
$1N37821: C7.2 U1.4(SS)
$1N38039: C8.2 C9.2 U1.6(COMP)
$1N38048: C8.1 R6.2
$1N38316: C1.1 U1.1(BOOT)
$1N38320: C1.2 D1.1(K) L1.1 U1.8(PH)
$1N38765: R1.1 R2.2 U1.5(VSENSE)
$1N40034: LED1.1(R-) R7.1
$1N40039: LED1.2(G-) R11.1
$1N40044: LED1.3(B-) R13.1
$1N40675: R12.2 U7.4(RXD)
$1N42733: R16.1 U11.49(U0TXD)
$1N46706: C23.2 U12.4(CPO)
$1N46710: C23.1 U12.5(CPI)
$1N47283: R21.1 U14.2(A)
$1N47663: C17.1 R15.2

Not connected (* = marked no-connect by the designer): U1 3(EN)*; U6 4(NC)*; U7 5(Vref)*; U11 1(LNA_IN) 28(SPICS1) 36(SPICLK_N) 37(SPICLK_P) 42(GPIO37) 43(GPIO38) 44(MTCK) 45(MTDO) 47(MTDI) 48(MTMS) 51(GPIO45) 52(GPIO46); U12 17(VREF)* 25(UNUSED)*; USB1 3(SBU2) 9(SBU1)

## Notes on the sheet
- USB TYPE C CONNECTOR
- INPUT VOLTAGE TO 5V REGULATOR
- ISOLATOR CIRCUIT
- EN : FLOAT TO ACTIVATE DEVICE
- EXTERNAL 5V
- 3V3 REGULATOR
- STATUS LED
- TJA1050 CAN TRANSCEIVER
- ESP32-S3 MCU CIRCUIT
- MOTOR DRIVER CIRCUIT
- ENCODER CIRCUIT
- GPIO15
- GPIO16
- ESP32 MEMORY
- BOOT & RESET BUTTON
